# Altium schematic sheet MCU.SchDoc
size A3; SheetNumber: 1; SheetTotal: 6
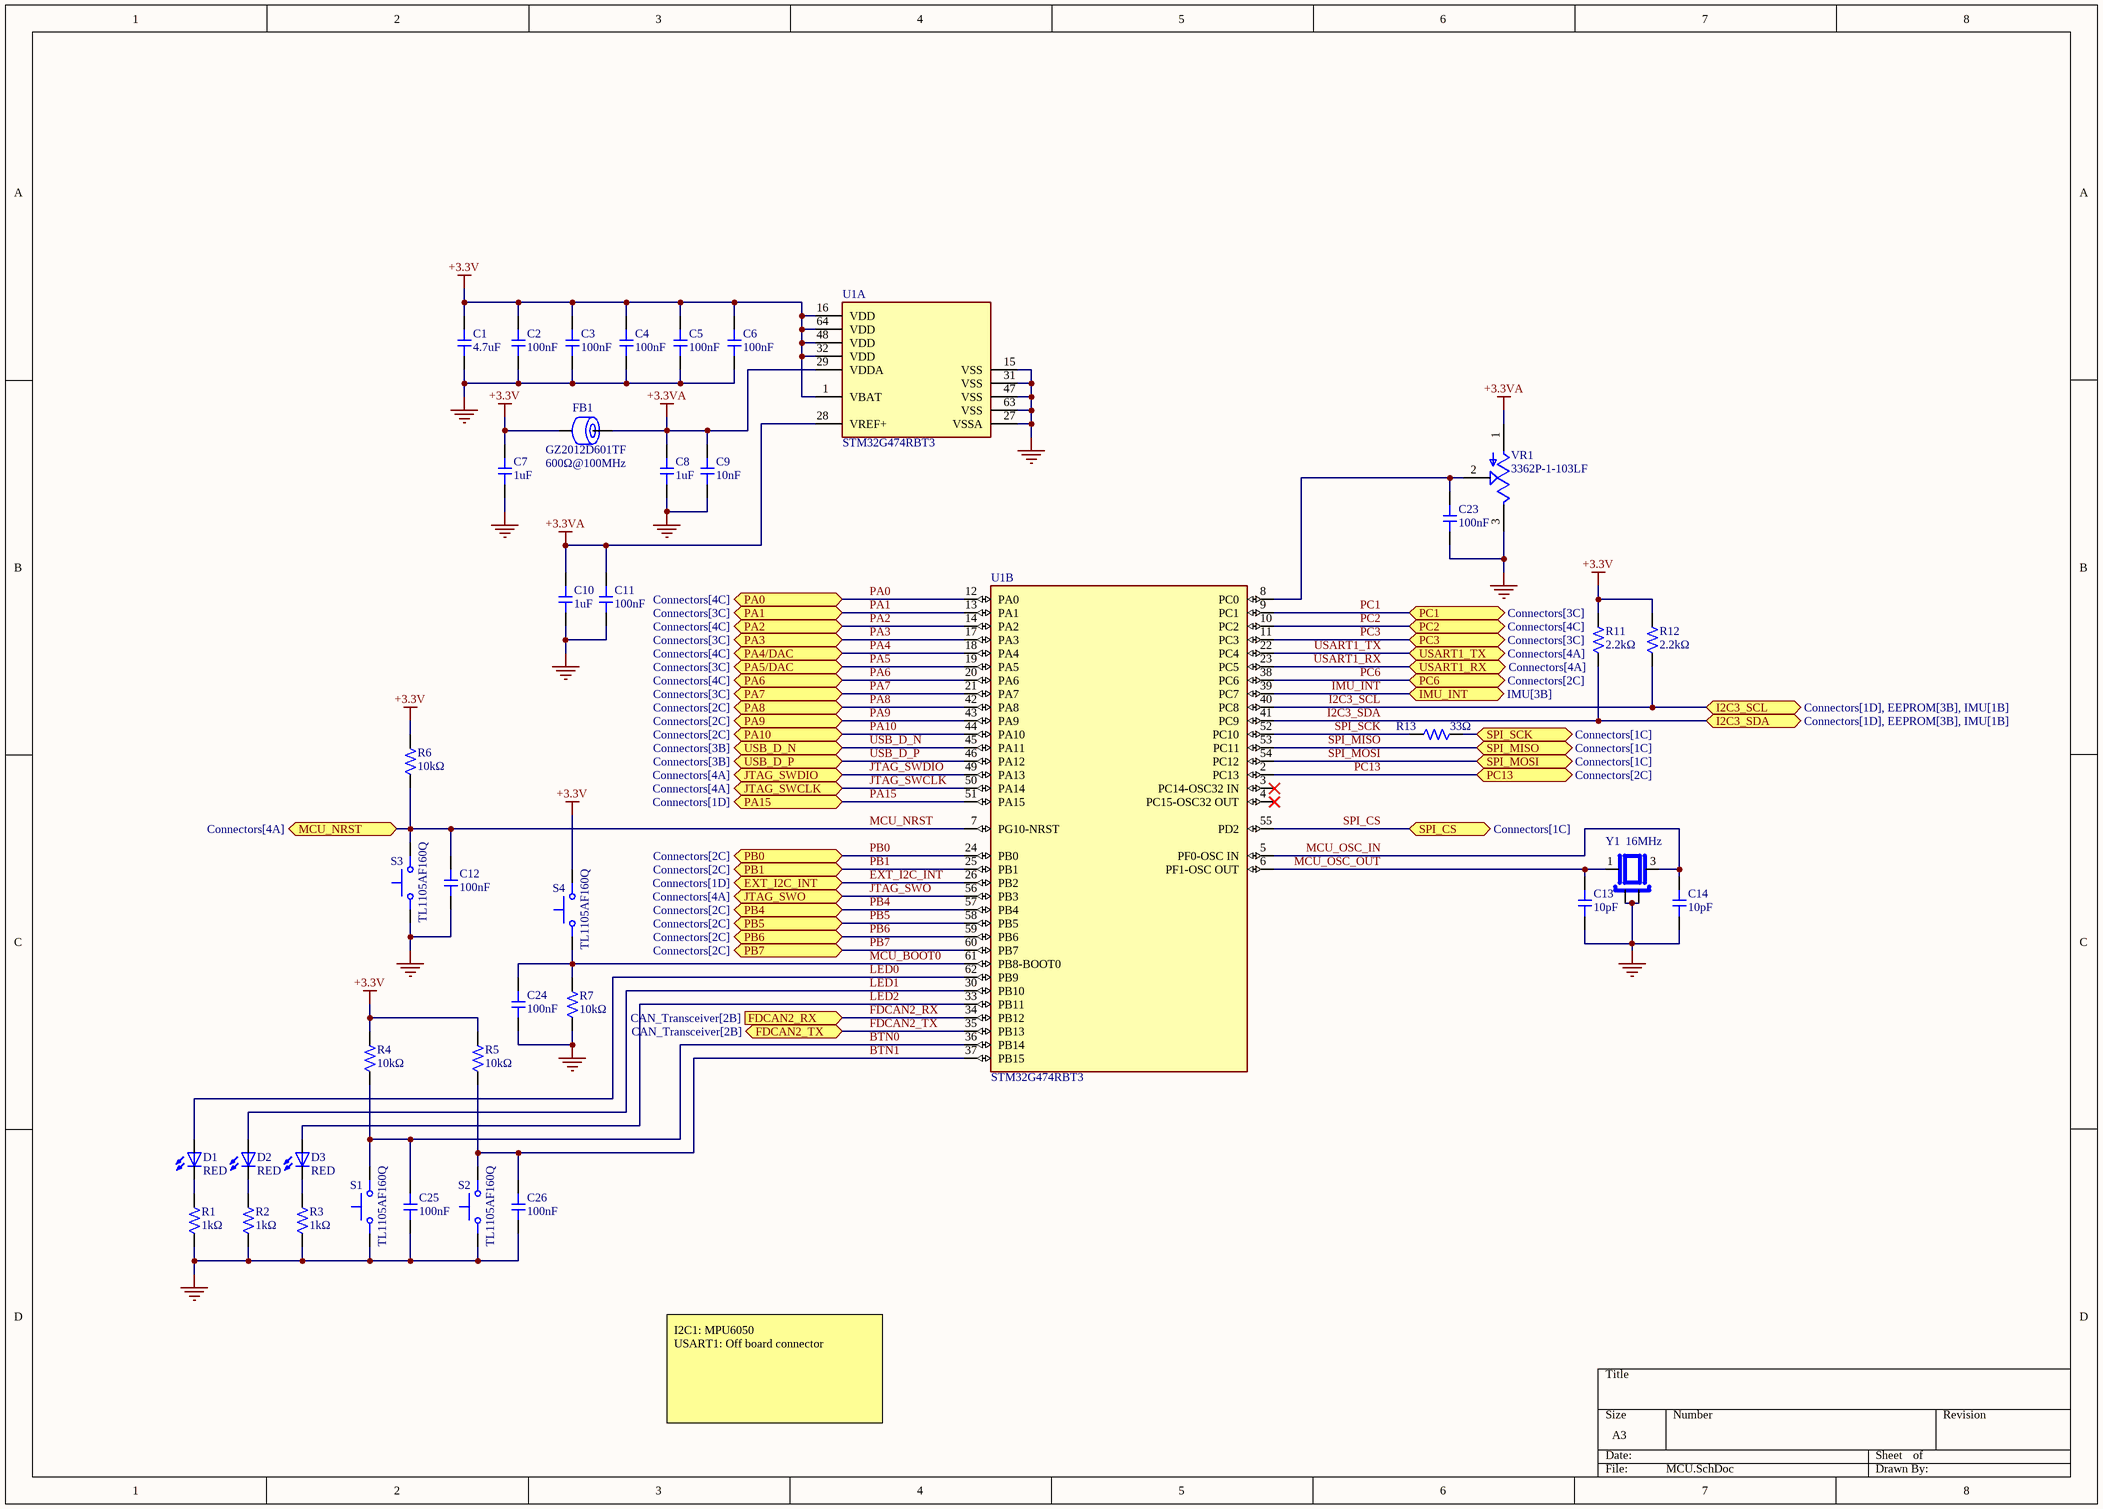
[diagram p0: MCU.SchDoc]

## Parts
C1  Capacitance: 4.7uF  [CAP-0402]  (hidden comment: CL05A475MP5NRNC)
C2  Capacitance: 100nF  [CAP-0402]  (hidden comment: CL05B104KO5NNNC)
C3  Capacitance: 100nF  [CAP-0402]  (hidden comment: CL05B104KO5NNNC)
C4  Capacitance: 100nF  [CAP-0402]  (hidden comment: CL05B104KO5NNNC)
C5  Capacitance: 100nF  [CAP-0402]  (hidden comment: CL05B104KO5NNNC)
C6  Capacitance: 100nF  [CAP-0402]  (hidden comment: CL05B104KO5NNNC)
C7  Capacitance: 1uF  [CAP-0402]  (hidden comment: CL05A105KA5NQNC)
C8  Capacitance: 1uF  [CAP-0402]  (hidden comment: CL05A105KA5NQNC)
C9  Capacitance: 10nF  [CAP-0402]  (hidden comment: CL05B103KB5NNNC)
C10  Capacitance: 1uF  [CAP-0402]  (hidden comment: CL05A105KA5NQNC)
C11  Capacitance: 100nF  [CAP-0402]  (hidden comment: CL05B104KO5NNNC)
C12  Capacitance: 100nF  [CAP-0402]  (hidden comment: CL05B104KO5NNNC)
C13  Capacitance: 10pF  [CAP-0402]  (hidden comment: CL05C100JB5NNNC)
C14  Capacitance: 10pF  [CAP-0402]  (hidden comment: CL05C100JB5NNNC)
C23  Capacitance: 100nF  [CAP-0402]  (hidden comment: CL05B104KO5NNNC)
C24  Capacitance: 100nF  [CAP-0402]  (hidden comment: CL05B104KO5NNNC)
C25  Capacitance: 100nF  [CAP-0402]  (hidden comment: CL05B104KO5NNNC)
C26  Capacitance: 100nF  [CAP-0402]  (hidden comment: CL05B104KO5NNNC)
D1  RED  [LED-0402]
D2  RED  [LED-0402]
D3  RED  [LED-0402]
FB1  GZ2012D601TF  Impedance @ Frequency: 600Ω@100MHz  [FB-0805]
R1  Resistance: 1kΩ  [RES-0402]  (hidden comment: 0402WGF1001TCE)
R2  Resistance: 1kΩ  [RES-0402]  (hidden comment: 0402WGF1001TCE)
R3  Resistance: 1kΩ  [RES-0402]  (hidden comment: 0402WGF1001TCE)
R4  Resistance: 10kΩ  [RES-0402]  (hidden comment: 0402WGF1002TCE)
R5  Resistance: 10kΩ  [RES-0402]  (hidden comment: 0402WGF1002TCE)
R6  Resistance: 10kΩ  [RES-0402]  (hidden comment: 0402WGF1002TCE)
R7  Resistance: 10kΩ  [RES-0402]  (hidden comment: 0402WGF1002TCE)
R11  Resistance: 2.2kΩ  [RES-0402]  (hidden comment: 0402WGF2201TCE)
R12  Resistance: 2.2kΩ  [RES-0402]  (hidden comment: 0402WGF2201TCE)
R13  Resistance: 33Ω  [RES-0402]  (hidden comment: 0402WGF330JTCE)
S1  TL1105AF160Q  [TL1105AF160Q]
S2  TL1105AF160Q  [TL1105AF160Q]
S3  TL1105AF160Q  [TL1105AF160Q]
S4  TL1105AF160Q  [TL1105AF160Q]
U1  STM32G474RBT3  [FP-LQFP64-5W-MFG]  (parts A,B of 2)
VR1  3362P-1-103LF  [TRIM_3362P-1-103LF]
Y1  16MHz  [OSC_X322516MLB4SI]

## Ports
EXT_I2C_INT (bidir, see Connectors[1D]), FDCAN2_RX (in, see CAN_Transceiver[2B]), FDCAN2_TX (bidir, see CAN_Transceiver[2B]), I2C3_SCL (bidir, see Connectors[1D], EEPROM[3B], IMU[1B]), I2C3_SDA (bidir, see Connectors[1D], EEPROM[3B], IMU[1B]), IMU_INT (bidir, see IMU[3B]), JTAG_SWCLK (bidir, see Connectors[4A]), JTAG_SWDIO (bidir, see Connectors[4A]), JTAG_SWO (bidir, see Connectors[4A]), MCU_NRST (bidir, see Connectors[4A]), PA0 (bidir, see Connectors[4C]), PA1 (bidir, see Connectors[3C]), PA2 (bidir, see Connectors[4C]), PA3 (bidir, see Connectors[3C]), PA4/DAC (bidir, see Connectors[4C]), PA5/DAC (bidir, see Connectors[3C]), PA6 (bidir, see Connectors[4C]), PA7 (bidir, see Connectors[3C]), PA8 (bidir, see Connectors[2C]), PA9 (bidir, see Connectors[2C]), PA10 (bidir, see Connectors[2C]), PA15 (bidir, see Connectors[1D]), PB0 (bidir, see Connectors[2C]), PB1 (bidir, see Connectors[2C]), PB4 (bidir, see Connectors[2C]), PB5 (bidir, see Connectors[2C]), PB6 (bidir, see Connectors[2C]), PB7 (bidir, see Connectors[2C]), PC1 (bidir, see Connectors[3C]), PC2 (bidir, see Connectors[4C]), PC3 (bidir, see Connectors[3C]), PC6 (bidir, see Connectors[2C]), PC13 (bidir, see Connectors[2C]), SPI_CS (bidir, see Connectors[1C]), SPI_MISO (bidir, see Connectors[1C]), SPI_MOSI (bidir, see Connectors[1C]), SPI_SCK (bidir, see Connectors[1C]), USART1_RX (bidir, see Connectors[4A]), USART1_TX (bidir, see Connectors[4A]), USB_D_N (bidir, see Connectors[3B]), USB_D_P (bidir, see Connectors[3B])

## Nets
+3.3V: C1.2 C2.2 C3.2 C4.2 C5.2 C6.2 C7.2 FB1.1 R4.2 R5.2 R6.2 R11.2 R12.2 S4.3 U1.1(VBAT) U1.16(VDD) U1.32(VDD) U1.48(VDD) U1.64(VDD)
+3.3VA: C8.2 C9.2 C10.2 C11.2 FB1.2 U1.28(VREF+) U1.29(VDDA) VR1.1(CCW)
GND: C1.1 C2.1 C3.1 C4.1 C5.1 C6.1 C7.1 C8.1 C9.1 C10.1 C11.1 C12.1 C13.1 C14.1 C23.1 C24.1 C25.1 C26.1 R1.1 R2.1 R3.1 R7.1 S1.1 S2.1 S3.1 U1.15(VSS) U1.27(VSSA) U1.31(VSS) U1.47(VSS) U1.63(VSS) VR1.3(CW) Y1.2(GND) Y1.4(GND)
BTN0: C25.2 R4.1 S1.3 U1.36(PB14)
BTN1: C26.2 R5.1 S2.3 U1.37(PB15)
EXT_I2C_INT: U1.26(PB2) ; port EXT_I2C_INT
FDCAN2_RX: U1.34(PB12) ; port FDCAN2_RX
FDCAN2_TX: U1.35(PB13) ; port FDCAN2_TX
I2C3_SCL: R12.1 U1.40(PC8) ; port I2C3_SCL
I2C3_SDA: R11.1 U1.41(PC9) ; port I2C3_SDA
IMU_INT: U1.39(PC7) ; port IMU_INT
JTAG_SWCLK: U1.50(PA14) ; port JTAG_SWCLK
JTAG_SWDIO: U1.49(PA13) ; port JTAG_SWDIO
JTAG_SWO: U1.56(PB3) ; port JTAG_SWO
LED0: D1.2(POS) U1.62(PB9)
LED1: D2.2(POS) U1.30(PB10)
LED2: D3.2(POS) U1.33(PB11)
MCU_BOOT0: C24.2 R7.2 S4.1 U1.61(PB8-BOOT0)
MCU_NRST: C12.2 R6.1 S3.3 U1.7(PG10-NRST) ; port MCU_NRST
MCU_OSC_IN: C14.2 U1.5(PF0-OSC_IN) Y1.3
MCU_OSC_OUT: C13.2 U1.6(PF1-OSC_OUT) Y1.1
PA0: U1.12(PA0) ; port PA0
PA1: U1.13(PA1) ; port PA1
PA2: U1.14(PA2) ; port PA2
PA3: U1.17(PA3) ; port PA3
PA4: U1.18(PA4) ; port PA4/DAC
PA5: U1.19(PA5) ; port PA5/DAC
PA6: U1.20(PA6) ; port PA6
PA7: U1.21(PA7) ; port PA7
PA8: U1.42(PA8) ; port PA8
PA9: U1.43(PA9) ; port PA9
PA10: U1.44(PA10) ; port PA10
PA15: U1.51(PA15) ; port PA15
PB0: U1.24(PB0) ; port PB0
PB1: U1.25(PB1) ; port PB1
PB4: U1.57(PB4) ; port PB4
PB5: U1.58(PB5) ; port PB5
PB6: U1.59(PB6) ; port PB6
PB7: U1.60(PB7) ; port PB7
PC1: U1.9(PC1) ; port PC1
PC2: U1.10(PC2) ; port PC2
PC3: U1.11(PC3) ; port PC3
PC6: U1.38(PC6) ; port PC6
PC13: U1.2(PC13) ; port PC13
SPI_CS: U1.55(PD2) ; port SPI_CS
SPI_MISO: U1.53(PC11) ; port SPI_MISO
SPI_MOSI: U1.54(PC12) ; port SPI_MOSI
SPI_SCK: R13.1 U1.52(PC10)
SPI_SCK: R13.2 ; port SPI_SCK  [a separate net that carries the same name]
USART1_RX: U1.23(PC5) ; port USART1_RX
USART1_TX: U1.22(PC4) ; port USART1_TX
USB_D_N: U1.45(PA11) ; port USB_D_N
USB_D_P: U1.46(PA12) ; port USB_D_P
NetC23_2: C23.2 U1.8(PC0) VR1.2(WIPER)
NetD1_1: D1.1(NEG) R1.2
NetD2_1: D2.1(NEG) R2.2
NetD3_1: D3.1(NEG) R3.2

Not connected (* = marked no-connect by the designer): U1 3(PC14-OSC32_IN)* 4(PC15-OSC32_OUT)*

## Notes on the sheet
- I2C1: MPU6050
  USART1: Off board connector

## Library data of the parts
C1 = CL05A475MP5NRNC: Capacitor, Ceramic (MLCC), 4.7uF, ±20%, 10V, X5R, ±20%, SMD 0402; Manufacturer: Samsung Electro-Mechanics; Temperature Rating: -55°C ~ 85°C; Capacitance @ 1V DC Bias: 4.048uF; Capacitance @ 1.2V DC Bias: 3.816uF; Capacitance @ 1.35V DC Bias: 3.633uF; Capacitance @ 1.5V DC Bias: 3.450uF; Capacitance @ 1.8V DC Bias: 3.100uF; Capacitance @ 2.5V DC Bias: 2.453uF; Capacitance @ 3.3V DC Bias: 1.872uF; Capacitance @ 3.7V DC Bias: 1.663uF; Capacitance @ 4.2V DC Bias: 1.455uF; Capacitance @ 5V DC Bias: 1.191uF; Capacitance @ 9V DC Bias: 0.548uF; Impedance (0V Bias) @ 100Hz: 442Ω; Impedance (0V Bias) @ 500Hz: 90.2Ω; Impedance (0V Bias) @ 1kHz: 45.6Ω; Impedance (0V Bias) @ 5kHz: 9.34Ω; Impedance (0V Bias) @ 10kHz: 4.72Ω; Impedance (0V Bias) @ 50kHz: 0.964Ω; Impedance (0V Bias) @ 100kHz: 0.486Ω; Impedance (0V Bias) @ 500kHz: 0.0987Ω; Impedance (0V Bias) @ 1MHz: 0.0479Ω; Impedance (0V Bias) @ 5MHz: 0.00709Ω; Impedance (0V Bias) @ 10MHz: 0.0183Ω; Impedance (0V Bias) @ 50MHz: 0.06Ω; Impedance (0V Bias) @ 100MHz: 0.102Ω; Impedance (0V Bias) @ 500MHz: 0.377Ω; Impedance (0V Bias) @ 1GHz: 0.66Ω; Impedance (0V Bias) @ 2GHz: 1.52Ω; Impedance (0V Bias) @ 5GHz: 3.05Ω; Impedance (10V Bias) @ 100Hz: 3.34E+03Ω; Impedance (10V Bias) @ 500Hz: 674Ω; Impedance (10V Bias) @ 1kHz: 338Ω; Impedance (10V Bias) @ 5kHz: 68.2Ω; Impedance (10V Bias) @ 10kHz: 34.2Ω; Impedance (10V Bias) @ 50kHz: 6.88Ω; Impedance (10V Bias) @ 100kHz: 3.45Ω; Impedance (10V Bias) @ 500kHz: 0.693Ω; Impedance (10V Bias) @ 1MHz: 0.344Ω; Impedance (10V Bias) @ 5MHz: 0.0603Ω; Impedance (10V Bias) @ 10MHz: 0.0164Ω; Impedance (10V Bias) @ 50MHz: 0.064Ω; Impedance (10V Bias) @ 100MHz: 0.105Ω; Impedance (10V Bias) @ 500MHz: 0.385Ω; Impedance (10V Bias) @ 1GHz: 0.673Ω; Impedance (10V Bias) @ 5GHz: 3.06Ω; Package Size: 0402; JLCPCB Basic Part: Yes; JLCPCB Part Number: C23733; Supplier 1: LCSC; Category: Capacitors - MLCC; Supplier Part Number 1: C23733; Manufacturer Part Number: CL05A475MP5NRNC; Tolerance: ±20%; Voltage Rating: 10V; Temperature Coefficient: X5R; RoHS: Yes; ComponentLink1Description: Datasheet; ComponentLink1URL: https://wmsc.lcsc.com/wmsc/upload/file/pdf/v2/lcsc/2304140030_Samsung-Electro-Mechanics-CL05A475MP5NRNC_C23733.pdf; ComponentLink2Description: JLCPCB Part URL; ComponentLink2URL: https://jlcpcb.com/partdetail/C23733; ComponentLink3Description: LCSC Part URL; ComponentLink3URL: https://lcsc.com/product-detail/Multilayer-Ceramic-Capacitors-MLCC---SMD-SMT_Samsung-Electro-Mechanics-Samsung-Electro-Mechanics-CL05A475MP5NRNC_C23733.html; ComponentLink4Description: Samsung Component Library; ComponentLink4URL: https://weblib.samsungsem.com/mlcc/mlcc-ec.do?partNumber=CL05A475MP5NRN; Impedance (10V Bias) @ 2GHz: 1.52Ω
C2-C6 C11 C12 C23-C26 = CL05B104KO5NNNC: Capacitor, Ceramic (MLCC), 100nF, ±10%, 16V, X7R, ±10%, SMD 0402; Manufacturer: Samsung Electro-Mechanics; Temperature Rating: -55°C ~ 125°C; Capacitance @ 1V DC Bias: 104.721nF; Capacitance @ 1.2V DC Bias: 104.598nF; Capacitance @ 1.35V DC Bias: 104.495nF; Capacitance @ 1.5V DC Bias: 104.372nF; Capacitance @ 1.8V DC Bias: 104.042nF; Capacitance @ 2.5V DC Bias: 102.634nF; Capacitance @ 3.3V DC Bias: 100.452nF; Capacitance @ 3.7V DC Bias: 99.160nF; Capacitance @ 4.2V DC Bias: 97.441nF; Capacitance @ 5V DC Bias: 94.577nF; Capacitance @ 9V DC Bias: 78.638nF; Capacitance @ 12V DC Bias: 66.291nF; Capacitance @ 15V DC Bias: 54.779nF; Impedance (0V Bias) @ 100Hz: 1.71E+04Ω; Impedance (0V Bias) @ 500Hz: 3.48E+03Ω; Impedance (0V Bias) @ 1kHz: 1.75E+03Ω; Impedance (0V Bias) @ 5kHz: 356Ω; Impedance (0V Bias) @ 10kHz: 179Ω; Impedance (0V Bias) @ 50kHz: 36.4Ω; Impedance (0V Bias) @ 100kHz: 18.3Ω; Impedance (0V Bias) @ 500kHz: 3.72Ω; Impedance (0V Bias) @ 1MHz: 1.87Ω; Impedance (0V Bias) @ 5MHz: 0.373Ω; Impedance (0V Bias) @ 10MHz: 0.175Ω; Impedance (0V Bias) @ 50MHz: 0.064Ω; Impedance (0V Bias) @ 100MHz: 0.122Ω; Impedance (0V Bias) @ 500MHz: 0.525Ω; Impedance (0V Bias) @ 1GHz: 0.97Ω; Impedance (0V Bias) @ 2GHz: 2.26Ω; Impedance (0V Bias) @ 5GHz: 4.75Ω; Impedance (16V Bias) @ 100Hz: 2.55E+04Ω; Impedance (16V Bias) @ 500Hz: 5.18E+03Ω; Impedance (16V Bias) @ 1kHz: 2.61E+03Ω; Impedance (16V Bias) @ 5kHz: 529Ω; Impedance (16V Bias) @ 10kHz: 266Ω; Impedance (16V Bias) @ 50kHz: 54Ω; Impedance (16V Bias) @ 100kHz: 27.2Ω; Impedance (16V Bias) @ 500kHz: 5.5Ω; Impedance (16V Bias) @ 1MHz: 2.76Ω; Impedance (16V Bias) @ 5MHz: 0.587Ω; Impedance (16V Bias) @ 10MHz: 0.277Ω; Impedance (16V Bias) @ 50MHz: 0.0412Ω; Impedance (16V Bias) @ 100MHz: 0.133Ω; Impedance (16V Bias) @ 500MHz: 0.524Ω; Impedance (16V Bias) @ 1GHz: 0.969Ω; Impedance (16V Bias) @ 2GHz: 2.25Ω; Impedance (16V Bias) @ 5GHz: 4.7Ω; Package Size: 0402; JLCPCB Basic Part: Yes; JLCPCB Part Number: C1525; Supplier 1: LCSC; Category: Capacitors - MLCC; Supplier Part Number 1: C1525; Manufacturer Part Number: CL05B104KO5NNNC; Tolerance: ±10%; Voltage Rating: 16V; Temperature Coefficient: X7R; RoHS: Yes; ComponentLink1Description: Datasheet; ComponentLink1URL: https://wmsc.lcsc.com/wmsc/upload/file/pdf/v2/lcsc/2304140030_Samsung-Electro-Mechanics-CL05B104KO5NNNC_C1525.pdf; ComponentLink2Description: JLCPCB Part URL; ComponentLink2URL: https://jlcpcb.com/partdetail/C1525; ComponentLink3Description: LCSC Part URL; ComponentLink3URL: https://lcsc.com/product-detail/Multilayer-Ceramic-Capacitors-MLCC---SMD-SMT_Samsung-Electro-Mechanics-Samsung-Electro-Mechanics-CL05B104KO5NNNC_C1525.html; ComponentLink4Description: Samsung Component Library; ComponentLink4URL: https://weblib.samsungsem.com/mlcc/mlcc-ec.do?partNumber=CL05B104KO5NNN
C7 C8 C10 = CL05A105KA5NQNC: Capacitor, Ceramic (MLCC), 1uF, ±10%, 25V, X5R, ±10%, SMD 0402; Manufacturer: Samsung Electro-Mechanics; Temperature Rating: -55°C ~ 85°C; Capacitance @ 1V DC Bias: 1.014uF; Capacitance @ 1.2V DC Bias: 0.983uF; Capacitance @ 1.35V DC Bias: 0.958uF; Capacitance @ 1.5V DC Bias: 0.932uF; Capacitance @ 1.8V DC Bias: 0.879uF; Capacitance @ 2.5V DC Bias: 0.755uF; Capacitance @ 3.3V DC Bias: 0.618uF; Capacitance @ 3.7V DC Bias: 0.562uF; Capacitance @ 4.2V DC Bias: 0.501uF; Capacitance @ 5V DC Bias: 0.420uF; Capacitance @ 9V DC Bias: 0.204uF; Capacitance @ 12V DC Bias: 0.147uF; Capacitance @ 15V DC Bias: 0.107uF; Capacitance @ 24V DC Bias: 0.061uF; Impedance (0V Bias) @ 100Hz: 1.95E+03Ω; Impedance (0V Bias) @ 500Hz: 402Ω; Impedance (0V Bias) @ 1kHz: 204Ω; Impedance (0V Bias) @ 5kHz: 42Ω; Impedance (0V Bias) @ 10kHz: 21.3Ω; Impedance (0V Bias) @ 50kHz: 4.4Ω; Impedance (0V Bias) @ 100kHz: 2.23Ω; Impedance (0V Bias) @ 500kHz: 0.462Ω; Impedance (0V Bias) @ 1MHz: 0.234Ω; Impedance (0V Bias) @ 5MHz: 0.0392Ω; Impedance (0V Bias) @ 10MHz: 0.0118Ω; Impedance (0V Bias) @ 50MHz: 0.0671Ω; Impedance (0V Bias) @ 100MHz: 0.118Ω; Impedance (0V Bias) @ 500MHz: 0.452Ω; Impedance (0V Bias) @ 1GHz: 0.812Ω; Impedance (0V Bias) @ 2GHz: 1.8Ω; Impedance (0V Bias) @ 5GHz: 3.57Ω; Impedance (25V Bias) @ 100Hz: 2.62E+04Ω; Impedance (25V Bias) @ 500Hz: 5.28E+03Ω; Impedance (25V Bias) @ 1kHz: 2.65E+03Ω; Impedance (25V Bias) @ 5kHz: 533Ω; Impedance (25V Bias) @ 10kHz: 267Ω; Impedance (25V Bias) @ 50kHz: 53.8Ω; Impedance (25V Bias) @ 100kHz: 27Ω; Impedance (25V Bias) @ 500kHz: 5.42Ω; Impedance (25V Bias) @ 1MHz: 2.7Ω; Impedance (25V Bias) @ 5MHz: 0.621Ω; Impedance (25V Bias) @ 10MHz: 0.298Ω; Impedance (25V Bias) @ 50MHz: 0.0523Ω; Impedance (25V Bias) @ 100MHz: 0.113Ω; Impedance (25V Bias) @ 500MHz: 0.451Ω; Impedance (25V Bias) @ 1GHz: 0.82Ω; Impedance (25V Bias) @ 2GHz: 1.85Ω; Impedance (25V Bias) @ 5GHz: 3.51Ω; Package Size: 0402; JLCPCB Basic Part: Yes; JLCPCB Part Number: C52923; Supplier 1: LCSC; Category: Capacitors - MLCC; Supplier Part Number 1: C52923; Manufacturer Part Number: CL05A105KA5NQNC; Tolerance: ±10%; Voltage Rating: 25V; Temperature Coefficient: X5R; RoHS: Yes; ComponentLink1Description: Datasheet; ComponentLink1URL: https://wmsc.lcsc.com/wmsc/upload/file/pdf/v2/lcsc/2304140030_Samsung-Electro-Mechanics-CL05A105KA5NQNC_C52923.pdf; ComponentLink2Description: JLCPCB Part URL; ComponentLink2URL: https://jlcpcb.com/partdetail/C52923; ComponentLink3Description: LCSC Part URL; ComponentLink3URL: https://lcsc.com/product-detail/Multilayer-Ceramic-Capacitors-MLCC---SMD-SMT_Samsung-Electro-Mechanics-Samsung-Electro-Mechanics-CL05A105KA5NQNC_C52923.html; ComponentLink4Description: Samsung Component Library; ComponentLink4URL: https://weblib.samsungsem.com/mlcc/mlcc-ec.do?partNumber=CL05A105KA5NQN
C9 = CL05B103KB5NNNC: Capacitor, Ceramic (MLCC), 10nF, ±10%, 50V, X7R, ±10%, SMD 0402; Manufacturer: Samsung Electro-Mechanics; Temperature Rating: -55°C ~ 125°C; Capacitance @ 1V DC Bias: 10.426nF; Capacitance @ 1.2V DC Bias: 10.434nF; Capacitance @ 1.35V DC Bias: 10.444nF; Capacitance @ 1.5V DC Bias: 10.455nF; Capacitance @ 1.8V DC Bias: 10.480nF; Capacitance @ 2.5V DC Bias: 10.514nF; Capacitance @ 3.3V DC Bias: 10.519nF; Capacitance @ 3.7V DC Bias: 10.504nF; Capacitance @ 4.2V DC Bias: 10.473nF; Capacitance @ 5V DC Bias: 10.402nF; Capacitance @ 9V DC Bias: 10.052nF; Capacitance @ 12V DC Bias: 9.639nF; Capacitance @ 15V DC Bias: 9.187nF; Capacitance @ 24V DC Bias: 7.606nF; Capacitance @ 36V DC Bias: 5.499nF; Capacitance @ 48V DC Bias: 3.591nF; Impedance (0V Bias) @ 100Hz: 1.57E+05Ω; Impedance (0V Bias) @ 500Hz: 3.19E+04Ω; Impedance (0V Bias) @ 1kHz: 1.61E+04Ω; Impedance (0V Bias) @ 5kHz: 3.27E+03Ω; Impedance (0V Bias) @ 10kHz: 1.65E+03Ω; Impedance (0V Bias) @ 50kHz: 335Ω; Impedance (0V Bias) @ 100kHz: 169Ω; Impedance (0V Bias) @ 500kHz: 34.3Ω; Impedance (0V Bias) @ 1MHz: 17.3Ω; Impedance (0V Bias) @ 5MHz: 3.52Ω; Impedance (0V Bias) @ 10MHz: 1.77Ω; Impedance (0V Bias) @ 50MHz: 0.285Ω; Impedance (0V Bias) @ 100MHz: 0.0835Ω; Impedance (0V Bias) @ 500MHz: 0.751Ω; Impedance (0V Bias) @ 1GHz: 1.42Ω; Impedance (0V Bias) @ 2GHz: 3.22Ω; Impedance (0V Bias) @ 5GHz: 6.48Ω; Package Size: 0402; JLCPCB Basic Part: Yes; JLCPCB Part Number: C15195; Supplier 1: LCSC; Category: Capacitors - MLCC; Supplier Part Number 1: C15195; Manufacturer Part Number: CL05B103KB5NNNC; Tolerance: ±10%; Voltage Rating: 50V; Temperature Coefficient: X7R; RoHS: Yes; ComponentLink1Description: Datasheet; ComponentLink1URL: https://wmsc.lcsc.com/wmsc/upload/file/pdf/v2/lcsc/2304140030_Samsung-Electro-Mechanics-CL05B103KB5NNNC_C15195.pdf; ComponentLink2Description: JLCPCB Part URL; ComponentLink2URL: https://jlcpcb.com/partdetail/C15195; ComponentLink3Description: LCSC Part URL; ComponentLink3URL: https://lcsc.com/product-detail/Multilayer-Ceramic-Capacitors-MLCC---SMD-SMT_Samsung-Electro-Mechanics-Samsung-Electro-Mechanics-CL05B103KB5NNNC_C15195.html; ComponentLink4Description: Samsung Component Library; ComponentLink4URL: https://weblib.samsungsem.com/mlcc/mlcc-ec.do?partNumber=CL05B103KB5NNN
C13 C14 = CL05C100JB5NNNC: Capacitor, Ceramic (MLCC), 10pF, ±5%, 50V, C0G, ±5%, SMD 0402; Manufacturer: Samsung Electro-Mechanics; Temperature Rating: -55°C ~ 125°C; Impedance (0V Bias) @ 100MHz: 159Ω; Impedance (0V Bias) @ 500MHz: 31Ω; Impedance (0V Bias) @ 1GHz: 14.2Ω; Impedance (0V Bias) @ 2GHz: 2.29Ω; Impedance (0V Bias) @ 5GHz: 4.97Ω; Package Size: 0402; JLCPCB Basic Part: Yes; JLCPCB Part Number: C32949; Supplier 1: LCSC; Category: Capacitors - MLCC; Supplier Part Number 1: C32949; Manufacturer Part Number: CL05C100JB5NNNC; Tolerance: ±5%; Voltage Rating: 50V; Temperature Coefficient: C0G; RoHS: Yes; ComponentLink1Description: Datasheet; ComponentLink1URL: https://wmsc.lcsc.com/wmsc/upload/file/pdf/v2/lcsc/2304140030_Samsung-Electro-Mechanics-CL05C100JB5NNNC_C32949.pdf; ComponentLink2Description: JLCPCB Part URL; ComponentLink2URL: https://jlcpcb.com/partdetail/C32949; ComponentLink3Description: LCSC Part URL; ComponentLink3URL: https://lcsc.com/product-detail/Multilayer-Ceramic-Capacitors-MLCC---SMD-SMT_Samsung-Electro-Mechanics-Samsung-Electro-Mechanics-CL05C100JB5NNNC_C32949.html; ComponentLink4Description: Samsung Component Library; ComponentLink4URL: https://weblib.samsungsem.com/mlcc/mlcc-ec.do?partNumber=CL05C100JB5NNN
D1-D3 = 16-213SDRC/S530-A3/TR8: -40℃~+85℃ 120° 20mA 2V 43mcd 639nm 650nm Red Water Clear 0402 LED Indication - Discrete ROHS; MF: WÃ¼rth Elektronik; MP: 150040GS73220; Package: 0402; Price: None; Value: *; SnapEDA_Link: https://www.snapeda.com/parts/150040GS73220/W%25C3%25BCrth+Elektronik+Midcom/view-part/?ref=snap; Availability: Unavailable; Check_prices: https://www.snapeda.com/parts/150040GS73220/W%25C3%25BCrth+Elektronik+Midcom/view-part/?ref=eda
FB1 = GZ2012D601TF: Ferrite, 600Ω@100MHz, ±25%, 300mΩ, 500mA, SMD 0805; Manufacturer: Sunlord; Package Size: 0805; JLCPCB Basic Part: Yes; JLCPCB Part Number: C1017; Supplier 1: LCSC; Category: Ferrite Beads; Supplier Part Number 1: C1017; Manufacturer Part Number: GZ2012D601TF; Tolerance: ±25%; Rated Current: 500mA; DC Resistance: 300mΩ; RoHS: Yes; ComponentLink1Description: Datasheet; ComponentLink1URL: https://wmsc.lcsc.com/wmsc/upload/file/pdf/v2/lcsc/2310301640_Sunlord-GZ2012D601TF_C1017.pdf; ComponentLink2Description: JLCPCB Part URL; ComponentLink2URL: https://jlcpcb.com/partdetail/C1017; ComponentLink3Description: LCSC Part URL; ComponentLink3URL: https://lcsc.com/product-detail/Ferrite-Beads_Sunlord-Sunlord-GZ2012D601TF_C1017.html
R1-R3 = 0402WGF1001TCE: Resistor, 1kΩ, ±1%, 62.5mW, 50V, ±100ppm/℃, -55℃~+155℃, SMD 0402; Manufacturer: Uniroyal; Supplier 1: LCSC; Manufacturer Part Number: 0402WGF1001TCE; Supplier Part Number 1: C11702; JLCPCB Part Number: C11702; Power Rating: 62.5mW; Category: Resistors; Package Size: 0402; JLCPCB Basic Part: Yes; Tolerance: ±1%; Voltage Rating: 50V; Temperature Coefficient: ±100ppm/℃; Temperature Rating: -55℃~+155℃; ComponentLink1Description: Datasheet; ComponentLink1URL: https://wmsc.lcsc.com/wmsc/upload/file/pdf/v2/lcsc/2206010216_UNI-ROYAL-Uniroyal-Elec-0402WGF1001TCE_C11702.pdf; ComponentLink2Description: JLCPCB Part URL; ComponentLink2URL: https://jlcpcb.com/partdetail/C11702
R4-R7 = 0402WGF1002TCE: Resistor, 10kΩ, ±1%, 62.5mW, 50V, ±100ppm/℃, -55℃~+155℃, SMD 0402; Manufacturer: Uniroyal; Supplier 1: LCSC; Manufacturer Part Number: 0402WGF1002TCE; Supplier Part Number 1: C25744; JLCPCB Part Number: C25744; Power Rating: 62.5mW; Category: Resistors; Package Size: 0402; JLCPCB Basic Part: Yes; Tolerance: ±1%; Voltage Rating: 50V; Temperature Coefficient: ±100ppm/℃; Temperature Rating: -55℃~+155℃; ComponentLink1Description: Datasheet; ComponentLink1URL: https://wmsc.lcsc.com/wmsc/upload/file/pdf/v2/lcsc/2206010100_UNI-ROYAL-Uniroyal-Elec-0402WGF1002TCE_C25744.pdf; ComponentLink2Description: JLCPCB Part URL; ComponentLink2URL: https://jlcpcb.com/partdetail/C25744
R11 R12 = 0402WGF2201TCE: Resistor, 2.2kΩ, ±1%, 62.5mW, 50V, ±100ppm/℃, -55℃~+155℃, SMD 0402; Manufacturer: Uniroyal; Supplier 1: LCSC; Manufacturer Part Number: 0402WGF2201TCE; Supplier Part Number 1: C25879; JLCPCB Part Number: C25879; Power Rating: 62.5mW; Category: Resistors; Package Size: 0402; JLCPCB Basic Part: Yes; Tolerance: ±1%; Voltage Rating: 50V; Temperature Coefficient: ±100ppm/℃; Temperature Rating: -55℃~+155℃; ComponentLink1Description: Datasheet; ComponentLink1URL: https://wmsc.lcsc.com/wmsc/upload/file/pdf/v2/lcsc/2206010045_UNI-ROYAL-Uniroyal-Elec-0402WGF2201TCE_C25879.pdf; ComponentLink2Description: JLCPCB Part URL; ComponentLink2URL: https://jlcpcb.com/partdetail/C25879
R13 = 0402WGF330JTCE: Resistor, 33Ω, ±1%, 62.5mW, 50V, ±100ppm/℃, -55℃~+155℃, SMD 0402; Manufacturer: Uniroyal; Supplier 1: LCSC; Manufacturer Part Number: 0402WGF330JTCE; Supplier Part Number 1: C25105; JLCPCB Part Number: C25105; Power Rating: 62.5mW; Category: Resistors; Package Size: 0402; JLCPCB Basic Part: Yes; Tolerance: ±1%; Voltage Rating: 50V; Temperature Coefficient: ±100ppm/℃; Temperature Rating: -55℃~+155℃; ComponentLink1Description: Datasheet; ComponentLink1URL: https://wmsc.lcsc.com/wmsc/upload/file/pdf/v2/lcsc/2205311900_UNI-ROYAL-Uniroyal-Elec-0402WGF330JTCE_C25105.pdf; ComponentLink2Description: JLCPCB Part URL; ComponentLink2URL: https://jlcpcb.com/partdetail/C25105
S1-S4 = TL1105AF160Q: Tactile Switch SPST-NO Top Actuated Through Hole; MF: E-Switch; SnapEDA_Link: https://www.snapeda.com/parts/TL1105AF160Q/E-Switch/view-part/?ref=snap; Package: None; Value: *; MP: TL1105AF160Q; Check_prices: https://www.snapeda.com/parts/TL1105AF160Q/E-Switch/view-part/?ref=eda
U1 = CMP-12105-000044-1: MAINSTREAM ARM CORTEX-M4 CORE WI; Manufacturer: STMicroelectronics; Ram Size: 128KBytes; Number Of Cores: 1; Number Of I2C Channels: 4; Data Bus Width: 32bits; Max Supply Voltage: 3.6V; Memory Type: FLASH; Number Of I/Os: 52; Number Of Spi Channels: 3; Memory Size: 512KBytes; Number Of Pwm Channels: 13; Max Junction Temp: +130°C; Number Of Adc Channels: 26; Number Of Timers/Counters: 14; Frequency: 170MHz; Interface: I2C,SPI,UART,USART,CAN,USB,LIN,IrDA,I2S,SMBus,Other; Standoff Height: 0.05mm; Number Of Uart Channels: 6; Min Supply Voltage: 1.62V; Device Class L3: Microcontrollers; Ambient Temperature Range Low: -40°C; Device Class L2: Embedded Processors and Controllers; Manufacturer Part Number: STM32G474RBT3; Digikey Description: MAINSTREAM ARM CORTEX-M4 CORE WI; Height: 1.6mm; Temperature Range Low: -40°C; RoHS: TRUE; Automotive: No; Lead Free: Yes; Device Class L1: Integrated Circuits (ICs); Package: LQFP64-5W; Octopart: https://octopart.com/stm32g474rbt3-stmicroelectronics-102823552; ComponentLink2URL: https://www.st.com/resource/en/datasheet/stm32g474rb.pdf; Number Of A/D Converters: 1; ComponentLink2Description: Datasheet; Core Architecture: ARM Cortex-M4; Temperature Range High: +125°C; Ambient Temperature Range High: +125°C; Temperature: -40°C to +125°C; Category: IC; Number Of Usb Channels: 1
VR1 = 3362P-1-103LF: Trimmer, Cermet, Rest 10 Kilohms, PCB, 1 Turns, Pwr-Rtg 0.5 W, Tol 10% | Bourns 3362P-1-103LF; SnapEDA_Link: https://www.snapeda.com/parts/3362P-1-103LF/Bourns/view-part/?ref=snap; Package: 3362P-1 Bourns Inc.; Value: *; MF: Bourns; MP: 3362P-1-103LF; Check_prices: https://www.snapeda.com/parts/3362P-1-103LF/Bourns/view-part/?ref=eda
Y1 = X322516MLB4SI: -40℃~+85℃ 16MHz 50Ω 10pF Crystal Oscillator ±10ppm ±20ppm SMD3225-4P Crystals ROHS; MF: YXC; SnapEDA_Link: https://www.snapeda.com/parts/X322516MLB4SI/YXC/view-part/?ref=snap; Package: Package; Value: *; MP: X322516MLB4SI; Check_prices: https://www.snapeda.com/parts/X322516MLB4SI/YXC/view-part/?ref=eda